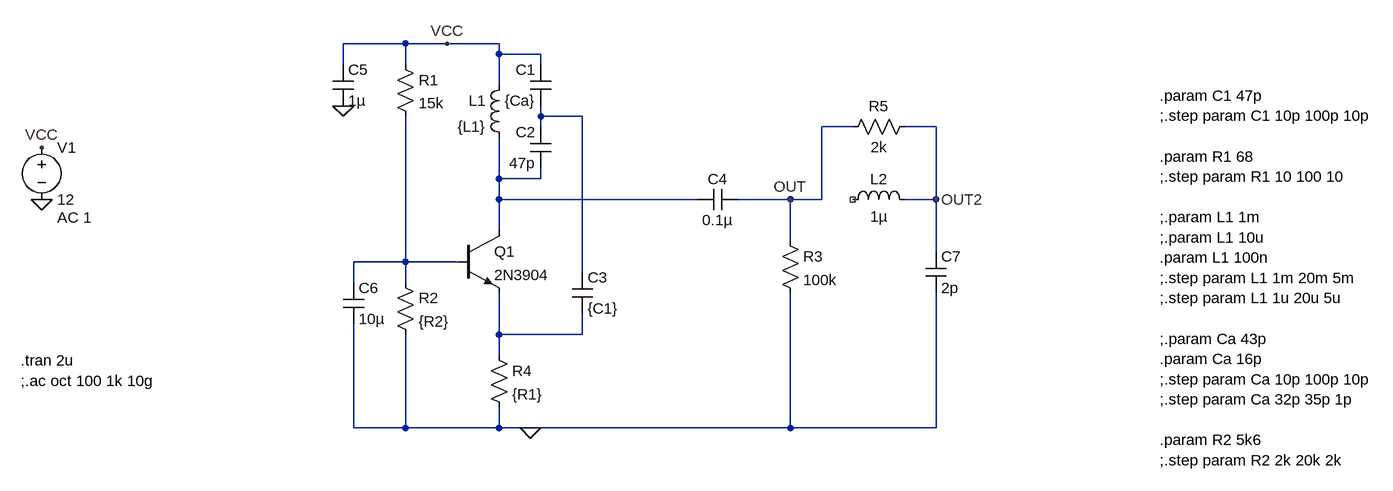
[diagram p0: schematic oscillator_colpitts2.asc]
oscillator_colpitts2.asc, the LTspice schematic file:
Version 4
SHEET 1 1708 680
WIRE 192 -48 96 -48
WIRE 256 -48 192 -48
WIRE 336 -48 256 -48
WIRE 336 -32 336 -48
WIRE 400 -32 336 -32
WIRE 96 -16 96 -48
WIRE 192 -16 192 -48
WIRE 400 -16 400 -32
WIRE 336 16 336 -32
WIRE 400 64 400 48
WIRE 464 64 400 64
WIRE 400 80 400 64
WIRE 880 80 832 80
WIRE 1008 80 960 80
WIRE 336 160 336 96
WIRE 400 160 400 144
WIRE 400 160 336 160
WIRE 336 192 336 160
WIRE 640 192 336 192
WIRE 784 192 704 192
WIRE 832 192 832 80
WIRE 832 192 784 192
WIRE 1008 192 1008 80
WIRE 1008 192 960 192
WIRE 336 240 336 192
WIRE 784 256 784 192
WIRE 1008 272 1008 192
WIRE 192 288 192 64
WIRE 192 288 112 288
WIRE 272 288 192 288
WIRE 464 304 464 64
WIRE 112 320 112 288
WIRE 192 320 192 288
WIRE 336 400 336 336
WIRE 464 400 464 368
WIRE 464 400 336 400
WIRE 336 432 336 400
WIRE 112 544 112 384
WIRE 192 544 192 400
WIRE 192 544 112 544
WIRE 336 544 336 512
WIRE 336 544 192 544
WIRE 384 544 336 544
WIRE 784 544 784 336
WIRE 784 544 384 544
WIRE 1008 544 1008 336
WIRE 1008 544 784 544
FLAG -368 192 0
FLAG -368 112 VCC
FLAG 96 48 0
FLAG 256 -48 VCC
FLAG 784 192 OUT
FLAG 384 544 0
FLAG 1008 192 OUT2
SYMBOL ind 352 0 M0
SYMATTR InstName L1
SYMATTR Value {L1}
SYMBOL cap 416 -16 M0
SYMATTR InstName C1
SYMATTR Value {Ca}
SYMBOL cap 416 80 M0
SYMATTR InstName C2
SYMATTR Value 47p
SYMBOL cap 704 176 R90
WINDOW 0 0 32 VBottom 2
WINDOW 3 32 32 VTop 2
SYMATTR InstName C4
SYMATTR Value 0.1µ
SYMBOL res 176 -32 R0
SYMATTR InstName R1
SYMATTR Value 15k
SYMBOL res 176 304 R0
SYMATTR InstName R2
SYMATTR Value {R2}
SYMBOL res 768 240 R0
SYMATTR InstName R3
SYMATTR Value 100k
SYMBOL npn 272 240 R0
SYMATTR InstName Q1
SYMATTR Value 2N3904
SYMBOL voltage -368 96 R0
WINDOW 123 24 124 Left 2
WINDOW 39 24 124 Left 2
SYMATTR Value2 AC 1
SYMATTR InstName V1
SYMATTR Value 12
SYMBOL cap 80 -16 R0
SYMATTR InstName C5
SYMATTR Value 1µ
SYMATTR SpiceLine V=25 Irms=0 Rser=0.007 Lser=0 mfg="TDK" pn="C3216X7RIE105M" type="X7R"
SYMBOL res 320 416 R0
SYMATTR InstName R4
SYMATTR Value {R1}
SYMBOL cap 96 320 R0
SYMATTR InstName C6
SYMATTR Value 10µ
SYMBOL cap 448 304 R0
SYMATTR InstName C3
SYMATTR Value {C1}
SYMBOL cap 992 272 R0
SYMATTR InstName C7
SYMATTR Value 2p
SYMBOL ind 864 208 R270
WINDOW 0 32 56 VTop 2
WINDOW 3 5 56 VBottom 2
SYMATTR InstName L2
SYMATTR Value 1µ
SYMATTR SpiceLine Rser=100
SYMBOL res 976 64 R90
WINDOW 0 0 56 VBottom 2
WINDOW 3 32 56 VTop 2
SYMATTR InstName R5
SYMATTR Value 2k
TEXT -400 440 Left 2 !.tran 2u\n;.ac oct 100 1k 10g
TEXT 1352 32 Left 2 !.param C1 47p\n;.step param C1 10p 100p 10p\n \n.param R1 68\n;.step param R1 10 100 10\n \n;.param L1 1m\n;.param L1 10u\n.param L1 100n\n;.step param L1 1m 20m 5m\n;.step param L1 1u 20u 5u\n \n;.param Ca 43p\n.param Ca 16p\n;.step param Ca 10p 100p 10p\n;.step param Ca 32p 35p 1p\n \n.param R2 5k6\n;.step param R2 2k 20k 2k

The netlist it stands for:
* oscillator_colpitts2.asc
L1 VCC N002 {L1}
C1 VCC N001 {Ca}
C2 N001 N002 47p
C4 OUT N002 0.1µ
R1 VCC N003 15k
R2 N003 0 {R2}
R3 OUT 0 100k
Q1 N002 N003 N004 0 2N3904
V1 VCC 0 12 AC 1
C5 VCC 0 1µ V=25 Irms=0 Rser=0.007 Lser=0 mfg="TDK" pn="C3216X7RIE105M" type="X7R"
R4 N004 0 {R1}
C6 N003 0 10µ
C3 N001 N004 {C1}
C7 OUT2 0 2p
L2 NC_01 OUT2 1µ Rser=100
R5 OUT2 OUT 2k
.model NPN NPN
.model PNP PNP
.lib standard.bjt
.tran 2u
;.ac oct 100 1k 10g
.param C1 47p
;.step param C1 10p 100p 10p
.param R1 68
;.step param R1 10 100 10
;.param L1 1m
;.param L1 10u
.param L1 100n
;.step param L1 1m 20m 5m
;.step param L1 1u 20u 5u
;.param Ca 43p
.param Ca 16p
;.step param Ca 10p 100p 10p
;.step param Ca 32p 35p 1p
.param R2 5k6
;.step param R2 2k 20k 2k
.backanno
.end